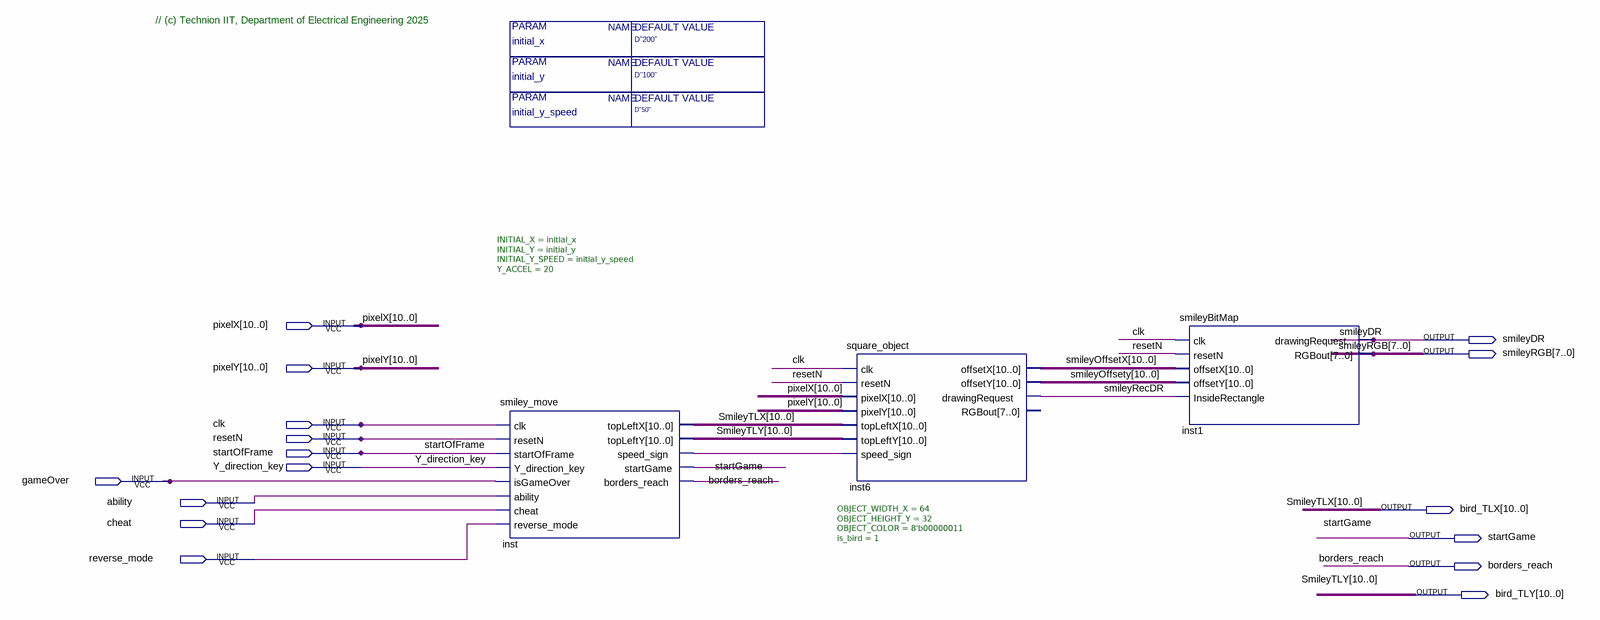
[diagram p0: schematic sheet]
// Quartus schematic Smiley_Block_T.bdf as structural Verilog: 3 symbols, 16 pins
module Smiley_Block_T #(parameter initial_y_speed = "D\"50\"", parameter initial_y = "D\"100\"", parameter initial_x = "D\"200\"") (
  input  [10:0] pixelX,
  input  [10:0] pixelY,
  input  clk,
  input  resetN,
  input  startOfFrame,
  input  Y_direction_key,
  input  gameOver,
  input  ability,
  input  cheat,
  input  reverse_mode,
  output smileyDR,
  output [7:0] smileyRGB,
  output [10:0] bird_TLX,
  output startGame,
  output borders_reach,
  output [10:0] bird_TLY
);

  wire inst_speed_sign, smileyRecDR;
  wire [10:0] smileyOffsetX, smileyOffsety;

  smiley_move #(.INITIAL_X(initial_x), .INITIAL_Y(initial_y), .INITIAL_Y_SPEED(initial_y_speed), .Y_ACCEL(20)) inst (
    .clk(clk), .resetN(resetN), .startOfFrame(startOfFrame), .Y_direction_key(Y_direction_key),
    .isGameOver(gameOver), .ability(ability), .cheat(cheat), .reverse_mode(reverse_mode),
    .topLeftX(bird_TLX), .topLeftY(bird_TLY), .speed_sign(inst_speed_sign), .startGame(startGame),
    .borders_reach(borders_reach));
  square_object #(.OBJECT_WIDTH_X(64), .OBJECT_HEIGHT_Y(32), .OBJECT_COLOR(8'b00000011), .is_bird(1)) inst6 (
    .clk(clk), .resetN(resetN), .pixelX(pixelX), .pixelY(pixelY), .topLeftX(bird_TLX), .topLeftY(bird_TLY),
    .speed_sign(inst_speed_sign), .offsetX(smileyOffsetX), .offsetY(smileyOffsety),
    .drawingRequest(smileyRecDR));  // open: RGBout
  smileyBitMap inst1 (
    .clk(clk), .resetN(resetN), .offsetX(smileyOffsetX), .offsetY(smileyOffsety),
    .InsideRectangle(smileyRecDR), .drawingRequest(smileyDR), .RGBout(smileyRGB));

  // Other names for the same wires on the sheet: SmileyTLX[10:0] = bird_TLX; SmileyTLY[10:0] = bird_TLY

  // Notes on the sheet:
  //   // (c) Technion IIT, Department of Electrical Engineering 2025
endmodule
